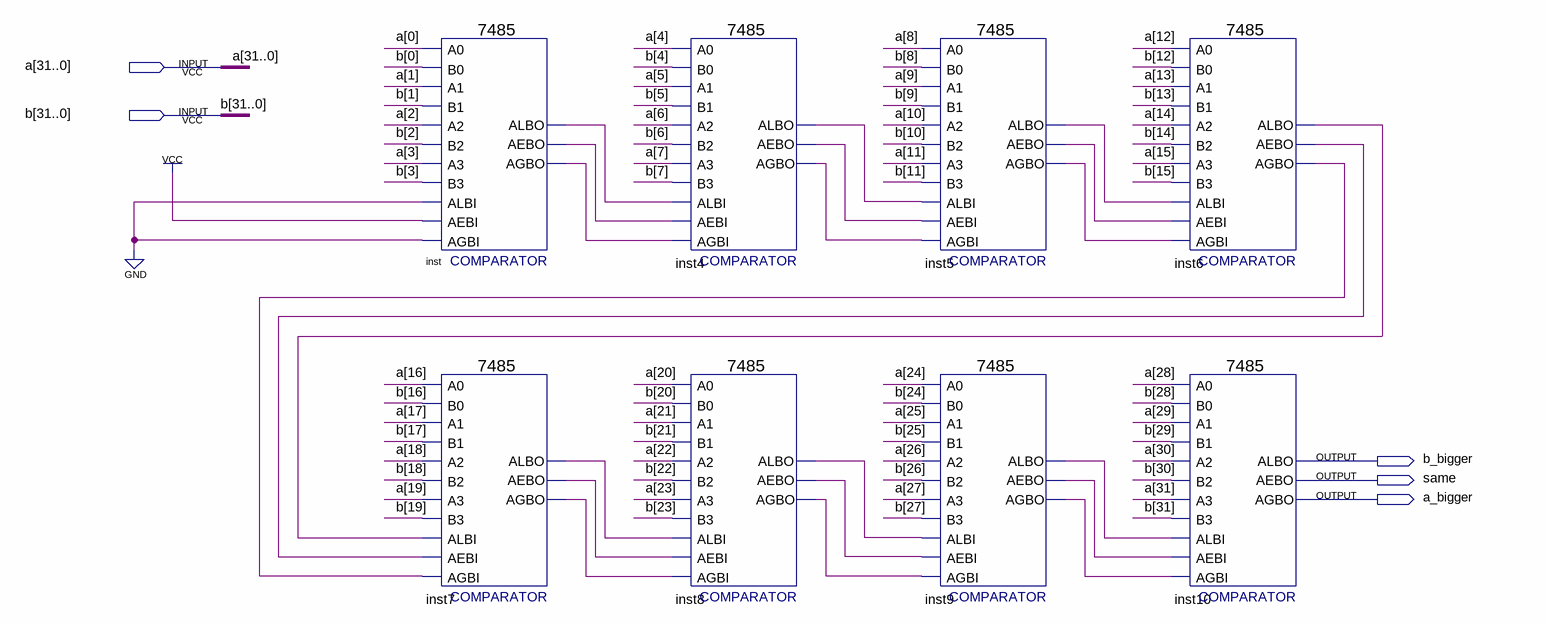
[diagram p0: schematic sheet]
// Quartus schematic CMP.bdf as structural Verilog: 8 symbols, 5 pins
module CMP (
  input  [31:0] a,
  input  [31:0] b,
  output b_bigger,
  output same,
  output a_bigger
);

  wire inst4_aebo, inst4_agbo, inst4_albo, inst5_aebo, inst5_agbo, inst5_albo, inst6_aebo, inst6_agbo,
       inst6_albo, inst7_aebo, inst7_agbo, inst7_albo, inst8_aebo, inst8_agbo, inst8_albo, inst9_aebo,
       inst9_agbo, inst9_albo, inst_aebo, inst_agbo, inst_albo;

  \7485  inst (
    .A3(a[3]), .B2(b[2]), .A2(a[2]), .AEBI(1'b1), .AGBI(1'b0), .ALBI(1'b0), .A0(a[0]), .B0(b[0]), .B3(b[3]),
    .A1(a[1]), .B1(b[1]), .ALBO(inst_albo), .AGBO(inst_agbo), .AEBO(inst_aebo));
  \7485  inst7 (
    .A3(a[19]), .B2(b[18]), .A2(a[18]), .AEBI(inst6_aebo), .AGBI(inst6_agbo), .ALBI(inst6_albo), .A0(a[16]),
    .B0(b[16]), .B3(b[19]), .A1(a[17]), .B1(b[17]), .ALBO(inst7_albo), .AGBO(inst7_agbo), .AEBO(inst7_aebo));
  \7485  inst4 (
    .A3(a[7]), .B2(b[6]), .A2(a[6]), .AEBI(inst_aebo), .AGBI(inst_agbo), .ALBI(inst_albo), .A0(a[4]),
    .B0(b[4]), .B3(b[7]), .A1(a[5]), .B1(b[5]), .ALBO(inst4_albo), .AGBO(inst4_agbo), .AEBO(inst4_aebo));
  \7485  inst8 (
    .A3(a[23]), .B2(b[22]), .A2(a[22]), .AEBI(inst7_aebo), .AGBI(inst7_agbo), .ALBI(inst7_albo), .A0(a[20]),
    .B0(b[20]), .B3(b[23]), .A1(a[21]), .B1(b[21]), .ALBO(inst8_albo), .AGBO(inst8_agbo), .AEBO(inst8_aebo));
  \7485  inst5 (
    .A3(a[11]), .B2(b[10]), .A2(a[10]), .AEBI(inst4_aebo), .AGBI(inst4_agbo), .ALBI(inst4_albo), .A0(a[8]),
    .B0(b[8]), .B3(b[11]), .A1(a[9]), .B1(b[9]), .ALBO(inst5_albo), .AGBO(inst5_agbo), .AEBO(inst5_aebo));
  \7485  inst9 (
    .A3(a[27]), .B2(b[26]), .A2(a[26]), .AEBI(inst8_aebo), .AGBI(inst8_agbo), .ALBI(inst8_albo), .A0(a[24]),
    .B0(b[24]), .B3(b[27]), .A1(a[25]), .B1(b[25]), .ALBO(inst9_albo), .AGBO(inst9_agbo), .AEBO(inst9_aebo));
  \7485  inst6 (
    .A3(a[15]), .B2(b[14]), .A2(a[14]), .AEBI(inst5_aebo), .AGBI(inst5_agbo), .ALBI(inst5_albo), .A0(a[12]),
    .B0(b[12]), .B3(b[15]), .A1(a[13]), .B1(b[13]), .ALBO(inst6_albo), .AGBO(inst6_agbo), .AEBO(inst6_aebo));
  \7485  inst10 (
    .A3(a[31]), .B2(b[30]), .A2(a[30]), .AEBI(inst9_aebo), .AGBI(inst9_agbo), .ALBI(inst9_albo), .A0(a[28]),
    .B0(b[28]), .B3(b[31]), .A1(a[29]), .B1(b[29]), .ALBO(b_bigger), .AGBO(a_bigger), .AEBO(same));
endmodule
